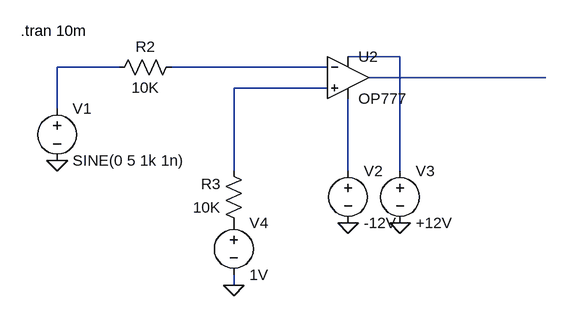
[diagram p0: schematic comparator1.asc]
comparator1.asc, the LTspice schematic file:
Version 4.1
SHEET 1 880 680
WIRE 272 96 192 96
WIRE -160 112 -256 112
WIRE 160 112 -80 112
WIRE 496 128 224 128
WIRE 160 144 16 144
WIRE -256 176 -256 112
WIRE 16 272 16 144
WIRE 192 272 192 160
WIRE 272 272 272 96
WIRE 16 448 16 432
FLAG -256 256 0
FLAG 192 352 0
FLAG 272 352 0
FLAG 16 448 0
SYMBOL res -64 96 R90
WINDOW 0 0 56 VBottom 2
WINDOW 3 32 56 VTop 2
SYMATTR InstName R2
SYMATTR Value 10K
SYMATTR SpiceLine tol=1 pwr=0.1
SYMBOL voltage -256 160 R0
WINDOW 123 0 0 Left 0
WINDOW 39 24 124 Left 2
SYMATTR InstName V1
SYMATTR Value SINE(0 5 1k 1n)
SYMBOL voltage 192 256 R0
WINDOW 123 0 0 Left 0
WINDOW 39 0 0 Left 0
SYMATTR InstName V2
SYMATTR Value -12V
SYMBOL voltage 272 256 R0
WINDOW 123 0 0 Left 0
WINDOW 39 0 0 Left 0
SYMATTR InstName V3
SYMATTR Value +12V
SYMBOL OpAmps\\OP777 192 64 R0
SYMATTR InstName U2
SYMBOL res 32 368 R180
WINDOW 0 36 76 Left 2
WINDOW 3 36 40 Left 2
SYMATTR InstName R3
SYMATTR Value 10K
SYMATTR SpiceLine tol=1 pwr=0.1
SYMBOL voltage 16 336 R0
WINDOW 123 0 0 Left 0
WINDOW 39 0 0 Left 0
SYMATTR InstName V4
SYMATTR Value 1V
TEXT -312 56 Left 2 !.tran 10m

The netlist it stands for:
* comparator1.asc
R2 N003 N002 10K tol=1 pwr=0.1
V1 N002 0 SINE(0 5 1k 1n)
V2 N006 0 -12V
V3 N001 0 +12V
X§U2 N005 N003 N001 N006 N004 OP777  ; pins In+ In- V+ V- OUT
R3 P001 N005 10K tol=1 pwr=0.1
V4 P001 0 1V
.tran 10m
.lib ADI.lib
.backanno
.end